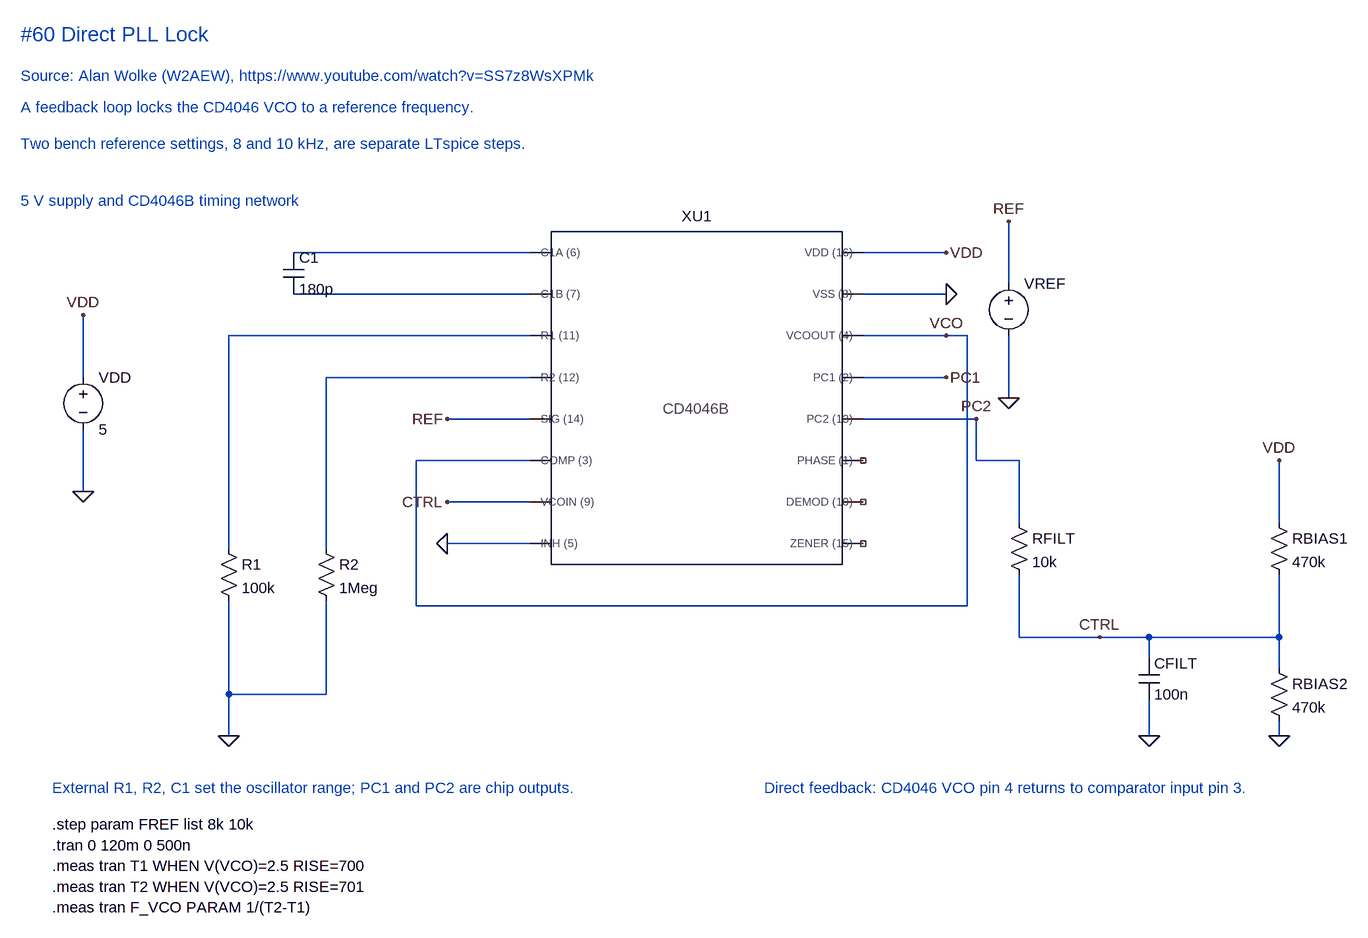
[diagram p0: schematic Direct PLL Lock.asc]
Direct PLL Lock.asc, the LTspice schematic file:
Version 4.1
SHEET 1 3500 1900
WIRE 864 0 500 0
WIRE 1504 0 1376 0
WIRE 1600 48 1600 -48
WIRE 864 64 500 64
WIRE 1504 64 1376 64
WIRE 864 128 400 128
WIRE 1504 128 1376 128
WIRE 1536 128 1504 128
WIRE 176 192 176 96
WIRE 864 192 550 192
WIRE 1504 192 1376 192
WIRE 1600 224 1600 128
WIRE 864 256 736 256
WIRE 1550 256 1376 256
WIRE 864 320 688 320
WIRE 1550 320 1550 256
WIRE 1616 320 1550 320
WIRE 176 368 176 272
WIRE 864 384 736 384
WIRE 1616 416 1616 320
WIRE 2016 416 2016 320
WIRE 864 448 736 448
WIRE 400 456 400 128
WIRE 550 456 550 192
WIRE 688 544 688 320
WIRE 1536 544 1536 128
WIRE 1536 544 688 544
WIRE 1616 592 1616 496
WIRE 1740 592 1616 592
WIRE 1816 592 1740 592
WIRE 2016 592 1816 592
WIRE 2016 592 2016 496
WIRE 1816 624 1816 592
WIRE 2016 640 2016 592
WIRE 1816 744 1816 688
WIRE 2016 744 2016 720
WIRE 400 680 400 536
WIRE 550 680 550 536
WIRE 550 680 400 680
WIRE 400 744 400 680
FLAG 176 96 VDD
FLAG 176 368 0
FLAG 400 744 0
FLAG 736 256 REF
FLAG 736 384 CTRL
FLAG 736 448 0
FLAG 1504 0 VDD
FLAG 1504 64 0
FLAG 1504 128 VCO
FLAG 1504 192 PC1
FLAG 1600 -48 REF
FLAG 1600 224 0
FLAG 1816 744 0
FLAG 2016 320 VDD
FLAG 2016 744 0
FLAG 1550 256 PC2
FLAG 1740 592 CTRL
SYMBOL voltage 176 176 R0
SYMATTR InstName VDD
SYMATTR Value 5
SYMBOL cap 484 0 R0
SYMATTR InstName C1
SYMATTR Value 180p
SYMBOL res 384 440 R0
SYMATTR InstName R1
SYMATTR Value 100k
SYMBOL res 534 440 R0
SYMATTR InstName R2
SYMATTR Value 1Meg
SYMBOL ..\..\LTspice\Symbols\CD4046_board 1120 0 R0
SYMATTR InstName XU1
SYMBOL voltage 1600 32 R0
WINDOW 3 24 96 Invisible 2
SYMATTR Value PULSE(0 5 0 20n 20n {0.5/FREF} {1/FREF})
SYMATTR InstName VREF
SYMBOL res 1600 400 R0
SYMATTR InstName RFILT
SYMATTR Value 10k
SYMBOL cap 1800 624 R0
SYMATTR InstName CFILT
SYMATTR Value 100n
SYMBOL res 2000 400 R0
SYMATTR InstName RBIAS1
SYMATTR Value 470k
SYMBOL res 2000 624 R0
SYMATTR InstName RBIAS2
SYMATTR Value 470k
TEXT 80 -168 Left 2 ;Two bench reference settings, 8 and 10 kHz, are separate LTspice steps.
TEXT 80 -80 Left 2 ;5 V supply and CD4046B timing network
TEXT 128 824 Left 2 ;External R1, R2, C1 set the oscillator range; PC1 and PC2 are chip outputs.
TEXT 1224 824 Left 2 ;Direct feedback: CD4046 VCO pin 4 returns to comparator input pin 3.
TEXT 128 880 Left 2 !.step param FREF list 8k 10k
TEXT 128 912 Left 2 !.tran 0 120m 0 500n
TEXT 128 944 Left 2 !.meas tran T1 WHEN V(VCO)=2.5 RISE=700
TEXT 128 976 Left 2 !.meas tran T2 WHEN V(VCO)=2.5 RISE=701
TEXT 128 1008 Left 2 !.meas tran F_VCO PARAM 1/(T2-T1)
TEXT 80 -336 Left 3 ;#60 Direct PLL Lock
TEXT 80 -272 Left 2 ;Source: Alan Wolke (W2AEW), https://www.youtube.com/watch?v=SS7z8WsXPMk
TEXT 80 -224 Left 2 ;A feedback loop locks the CD4046 VCO to a reference frequency.

The netlist it stands for:
* Direct PLL Lock.asc
VDD VDD 0 5
C1 N001 N002 180p
R1 N003 0 100k
R2 N004 0 1Meg
X§XU1 N001 N002 VCO 0 N003 N004 REF CTRL VDD 0 NC_01 PC1 PC2 NC_02 VCO NC_03 CD4046Bg  ; pins C1A_(6) C1B_(7) COMP_(3) INH_(5) R1_(11) R2_(12) SIG_(14) VCOIN_(9) VDD_(16) VSS_(8) DEMOD_(10) PC1_(2) PC2_(13) PHASE_(1) VCOOUT_(4) ZENER_(15)
VREF REF 0 PULSE(0 5 0 20n 20n {0.5/FREF} {1/FREF})
RFILT PC2 CTRL 10k
CFILT CTRL 0 100n
RBIAS1 VDD CTRL 470k
RBIAS2 CTRL 0 470k
* Two bench reference settings, 8 and 10 kHz, are separate LTspice steps.
* 5 V supply and CD4046B timing network
* External R1, R2, C1 set the oscillator range; PC1 and PC2 are chip outputs.
* Direct feedback: CD4046 VCO pin 4 returns to comparator input pin 3.
.step param FREF list 8k 10k
.tran 0 120m 0 500n
.meas tran T1 WHEN V(VCO)=2.5 RISE=700
.meas tran T2 WHEN V(VCO)=2.5 RISE=701
.meas tran F_VCO PARAM 1/(T2-T1)
* #60 Direct PLL Lock
* Source: Alan Wolke (W2AEW), https://www.youtube.com/watch?v=SS7z8WsXPMk
* A feedback loop locks the CD4046 VCO to a reference frequency.
.lib ..\..\LTspice\Models\Community\CD4046Bg-corrected.sub
.backanno
.end